# Altium schematic sheet Memory_Section.SchDoc
size A4; DocumentNumber: 22; SheetNumber: 22; SheetTotal: 28
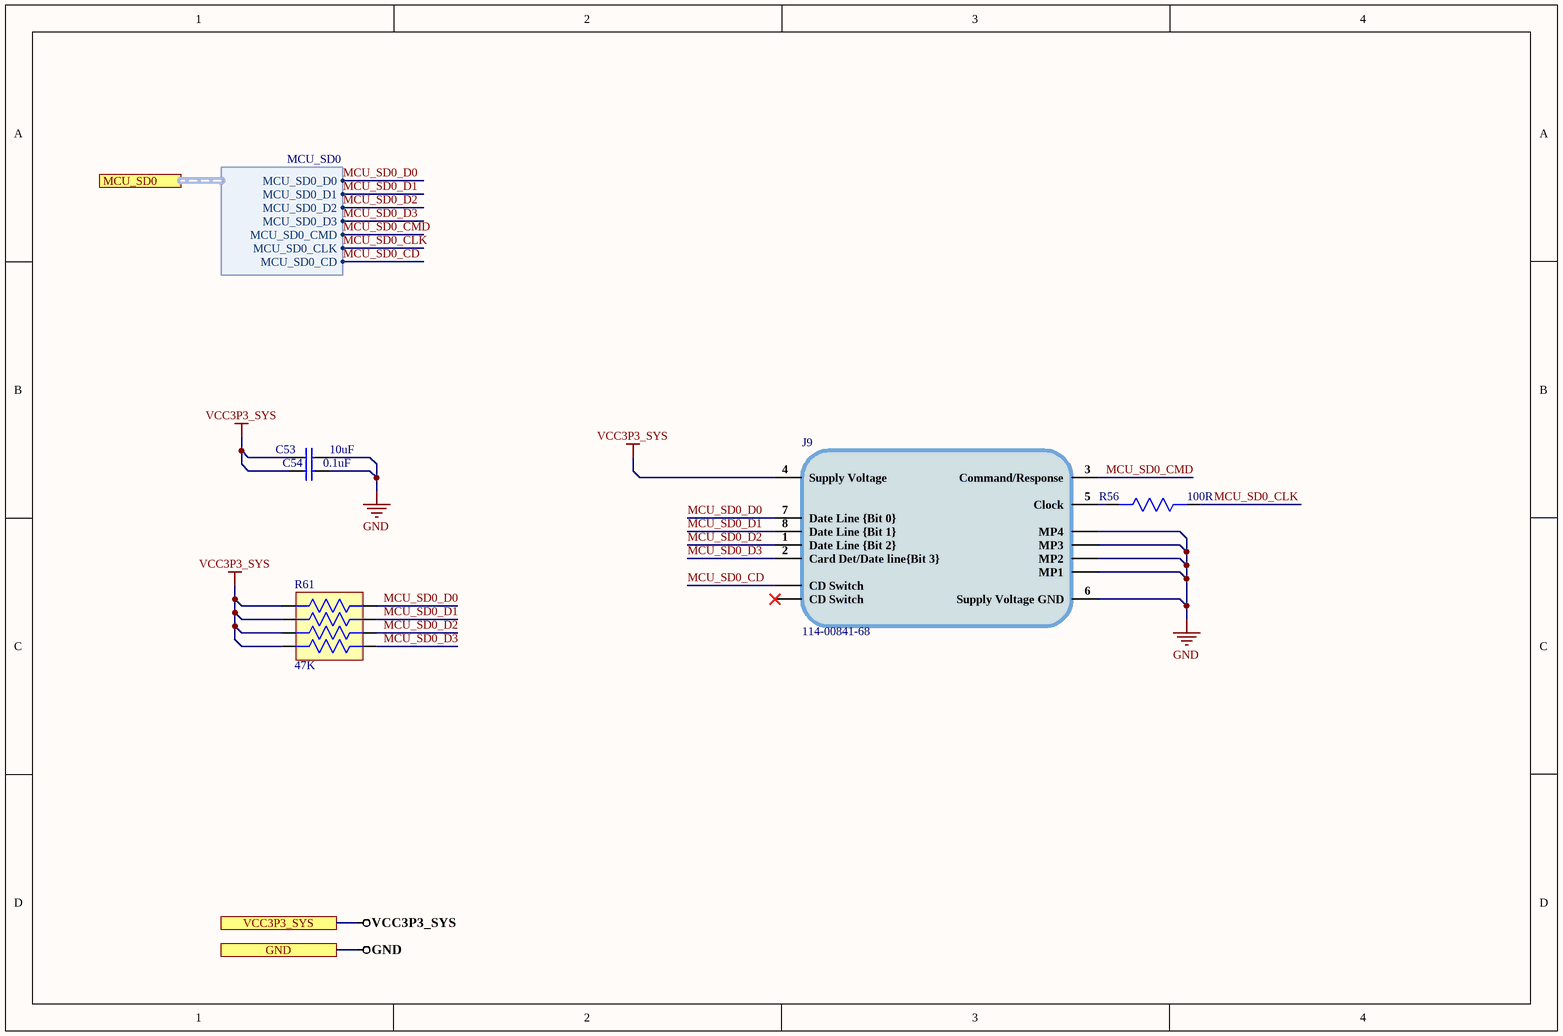
[diagram p0: Memory_Section.SchDoc]

## Parts
C53  10uF  [Cap0603]
C54  0.1uF  [Cap0603]
J9  114-00841-68  [114-00841-68]
R56  100R  [Res0603]
R61  47K  [CAY10-473J4LF]

## Ports
GND, MCU_SD0 (harness MCU_SD0), VCC3P3_SYS

## Harnesses
MCU_SD0: MCU_SD0_D0, MCU_SD0_D1, MCU_SD0_D2, MCU_SD0_D3, MCU_SD0_CMD, MCU_SD0_CLK, MCU_SD0_CD

## Nets
GND: C53.2 C54.2 J9.6(Supply_Voltage_GND) J9.MP1 J9.MP2 J9.MP3 J9.MP4 ; port GND
VCC3P3_SYS: C53.1 C54.1 J9.4(Supply_Voltage) R61.1 R61.2 R61.3 R61.4 ; port VCC3P3_SYS
MCU_SD0_CD: J9.*CD_Switch(CD_Switch) ; port MCU_SD0.MCU_SD0_CD
MCU_SD0_CLK: R56.1 ; port MCU_SD0.MCU_SD0_CLK
MCU_SD0_CMD: J9.3(Command/Response) ; port MCU_SD0.MCU_SD0_CMD
MCU_SD0_D0: J9.7(Date_Line_{Bit_0}) R61.8 ; port MCU_SD0.MCU_SD0_D0
MCU_SD0_D1: J9.8(Date_Line_{Bit_1}) R61.7 ; port MCU_SD0.MCU_SD0_D1
MCU_SD0_D2: J9.1(Date_Line_{Bit_2}) R61.6 ; port MCU_SD0.MCU_SD0_D2
MCU_SD0_D3: J9.2(Card_Det/Date_line{Bit_3}) R61.5 ; port MCU_SD0.MCU_SD0_D3
NetJ9_5: J9.5(Clock) R56.2

Not connected (* = marked no-connect by the designer): J9 #CD Switch(CD_Switch)*

## Library data of the parts
C53 = GRM188R6YA106MA73D: CAP CER 10UF 35V X5R 0603; Manufacturer: Murata; Tolerance: 20%; Supplier 1: Digi-Key; Manufacturer Part Number: GRM188R6YA106MA73D; Stock 1: 11640; Pricing 1: 1=0.5, 10=0.346, 100=0.2076, 500=0.1557, 1000=0.13148 (USD); Mount: Surface Mount; Case/Package: 0603; Case Code (Metric): 1608; Case Code (Imperial): 0603; Min Operating Temperature: -55°C; Max Operating Temperature: 85°C; Packaging: Tape and Reel; Capacitance: 10uF; Voltage Rating: 35V; Voltage Rating (DC): 35V; Dielectric: X5R; Length: 0.063inch; Width: 0.031inch; Thickness: 0.039inch; ComponentLink1URL: http://search.murata.co.jp/Ceramy/image/img/A01X/G101/ENG/GRM188R6YA106MA73-01.pdf?src-supplier=Digi-Key; ComponentLink1Description: http://search.murata.co.jp/Ceramy/image/img/A01X/G101/ENG/GRM188R6YA106MA73-01.pdf?src-supplier=Digi-Key; ComponentLink2URL: http://search.murata.co.jp/Ceramy/image/img/A01X/G101/ENG/GRM188R6YA106MA73-01.pdf?src-supplier=Mouser; ComponentLink2Description: http://search.murata.co.jp/Ceramy/image/img/A01X/G101/ENG/GRM188R6YA106MA73-01.pdf?src-supplier=Mouser; ComponentLink3URL: https://www.murata.com/~/media/webrenewal/support/library/catalog/products/capacitor/mlcc/c02e.ashx?la=en-us&src-supplier=Digi-Key; ComponentLink3Description: https://www.murata.com/~/media/webrenewal/support/library/catalog/products/capacitor/mlcc/c02e.ashx?la=en-us&src-supplier=Digi-Key; ComponentLink4URL: http://search.murata.co.jp/Ceramy/image/img/A01X/G101/ENG/GRM188R6YA106MA73-01.pdf?src-supplier=Future+Electronics; ComponentLink4Description: http://search.murata.co.jp/Ceramy/image/img/A01X/G101/ENG/GRM188R6YA106MA73-01.pdf?src-supplier=Future+Electronics; ComponentLink5URL: http://search.murata.co.jp/Ceramy/image/img/A01X/G101/ENG/GRM188R6YA106MA73-01.pdf?src-supplier=TTI; ComponentLink5Description: http://search.murata.co.jp/Ceramy/image/img/A01X/G101/ENG/GRM188R6YA106MA73-01.pdf?src-supplier=TTI; Supplier Part Number 1: 490-13248-6-ND
C54 = CC0603ZRY5V9BB104: CAP CER 0.1UF 50V Y5V 0603; Manufacturer: Yageo; Capacitance: 100nF; Tolerance: 80%; Supplier 1: Digi-Key; Manufacturer Part Number: CC0603ZRY5V9BB104; Stock 1: 15000880; Pricing 1: 1=0.1, 10=0.075, 100=0.0334, 500=0.02386, 1000=0.01874 (USD); Mount: Surface Mount; Case/Package: 0603; Number of Pins: 2; Case Code (Metric): 1608; Case Code (Imperial): 0603; Min Operating Temperature: -30°C; Max Operating Temperature: 85°C; Dielectric: Y5V; Voltage Rating: 50V; Package Quantity: 1; Packaging: Tape and Reel; Voltage Rating (DC): 50V; Termination: SMD/SMT; Composition: Ceramic; Voltage: 50V; Length: 1.6mm; Height: 0.8mm; Width: 0.031inch; Thickness: 0.035inch; Depth: 0.8mm; Radiation Hardening: No; REACH SVHC: No SVHC; Lead Free: Lead Free; Halogen Free: Halogen Free; ComponentLink1URL: http://www.yageo.com/documents/recent/UPY-GPHC_Y5V_6.3V-to-50V_8.pdf?src-supplier=Digi-Key; ComponentLink1Description: http://www.yageo.com/documents/recent/UPY-GPHC_Y5V_6.3V-to-50V_8.pdf?src-supplier=Digi-Key; ComponentLink2URL: http://www.yageo.com/documents/recent/UPY-GPHC_Y5V_6.3V-to-50V_5.pdf?src-supplier=Avnet+Europe; ComponentLink2Description: http://www.yageo.com/documents/recent/UPY-GPHC_Y5V_6.3V-to-50V_5.pdf?src-supplier=Avnet+Europe; ComponentLink3URL: https://www.verical.com/server-webapp/html/getDatasheet?partID=403611&src-supplier=Verical; ComponentLink3Description: https://www.verical.com/server-webapp/html/getDatasheet?partID=403611&src-supplier=Verical; ComponentLink4URL: http://www.mouser.com/ds/2/447/Yageo_UPY-GP_NP0_16V-to-50V_9-358835.pdf?src-supplier=Mouser; ComponentLink4Description: http://www.mouser.com/ds/2/447/Yageo_UPY-GP_NP0_16V-to-50V_9-358835.pdf?src-supplier=Mouser; ComponentLink5URL: http://www.farnell.com/datasheets/1132289.pdf?src-supplier=Element14; ComponentLink5Description: http://www.farnell.com/datasheets/1132289.pdf?src-supplier=Element14; Supplier Part Number 1: 311-1343-1-ND
J9 = 114-00841-68: CONN MICRO SD CARD PUSH-PULL R/A; Manufacturer: AMPHENOL ICC (COMMERCIAL PRODUCTS); Connector Type: Connector; Supplier 1: Digi-Key; Manufacturer Part Number: 114-00841-68; Stock 1: 29968; Pricing 1: 1=1.32, 10=1.194, 25=1.1208, 50=1.0722, 100=1.0235, 250=0.926, 500=0.8529 (USD); Mount: Surface Mount; Contact Plating: Gold; Packaging: Tape and Reel; Supplier Part Number 1: 114-00841-68-6-ND
R56 = RC0603FR-07100RL: RES SMD 100 OHM 1% 1/10W 0603; Manufacturer: Yageo; Temperature Coefficient: 100ppm/°C; Voltage Rating (DC): 50V; Power Rating: 100mW; Supplier 1: Arrow Electronics; Manufacturer Part Number: RC0603FR-07100RL; RoHS: Yes; Category: Chip SMD Resistors; Stock 1: 3800000; Pricing 1: 5000=0.00300, 5000=0.00200, 5000=0.00450, 50000=0.00410, 500000=0.00230, 2500000=0.00140 (USD); Case/Package: 0603; Number of Pins: 2; Case Code (Imperial): 0603; Case Code (Metric): 1608; Size Code: 0603; Min Operating Temperature: -55°C; Max Operating Temperature: 155°C; Resistance: 100R; Tolerance: 1%; Resistor Type: Thick Film; Packaging: Tape and Reel; Voltage Rating: 50V; Termination: SMD/SMT; Features: Moisture Resistant; Series: RC; Max Power Dissipation: 100mW; Number of Terminations: 2; Construction: Rectangular; Resistance Tolerance: 1%; Technology: THICK FILM; Length: 1.6mm; Width: 0.8mm; Height: 0.45mm; Depth: 0.8mm; REACH SVHC: Unknown; Lead Free: Lead Free; RoHS Compliant: Yes; Military Standard: Not; Supplier Part Number 1: RC0603FR-07100RL
R61 = CAY10-473J4LF: RES ARRAY 4 RES 47K OHM 0804; Manufacturer: Bourns; Number of Terminals/Pins: 8; Resistance: 47kR; Number of Resistors: 4; Temperature Coefficient: 250ppm/°C; Power Rating: 125mW; Tolerance: 5%; Voltage Rating: 25V; Circuit Type: Isolated; Power Per Element: 62.5mW; Supplier 1: Digi-Key; Manufacturer Part Number: CAY10-473J4LF; RoHS: Yes; Category: Resistor Arrays; Stock 1: 11037; Pricing 1: 1=0.12000, 10=0.10400, 25=0.07200, 50=0.05600, 100=0.04000, 250=0.03120, 500=0.02480, 1000=0.01760, 5000=0.01360 (USD); Mount: Surface Mount; Case/Package: 0804; Number of Pins: 8; Case Code (Metric): 2010; Case Code (Imperial): 0804; Contact Plating: Tin; Min Operating Temperature: -55°C; Max Operating Temperature: 125°C; Packaging: Tape and Reel; Package Quantity: 1; Number of Elements: 4; Termination: Convex; Voltage Rating (DC): 25V; Series: CAY10; Resistance Tolerance: 5%; Technology: THICK FILM; Length: 2mm; Width: 0.039inch; Height: 0.018inch; Terminal Pitch: 0.5mm; Depth: 1mm; REACH SVHC: No SVHC; Military Standard: Not; RoHS Compliant: Yes; ComponentLink1URL: https://datasheet.ciiva.com/11807/0900766b8064e463-11807137.pdf?src-supplier=RSComponents; ComponentLink1Description: https://datasheet.ciiva.com/11807/0900766b8064e463-11807137.pdf?src-supplier=RSComponents; ComponentLink2URL: https://datasheet.ciiva.com/6494/cay10-6494182.pdf?src-supplier=Digi-Key; ComponentLink2Description: https://datasheet.ciiva.com/6494/cay10-6494182.pdf?src-supplier=Digi-Key; ComponentLink3URL: https://datasheet.ciiva.com/16965/cay10-16965867.pdf?src-supplier=Avnet+Europe; ComponentLink3Description: https://datasheet.ciiva.com/16965/cay10-16965867.pdf?src-supplier=Avnet+Europe; ComponentLink4URL: https://datasheet.ciiva.com/22712/467939-22712716.pdf?src-supplier=Element14; ComponentLink4Description: https://datasheet.ciiva.com/22712/467939-22712716.pdf?src-supplier=Element14; ComponentLink5URL: https://datasheet.ciiva.com/6494/cay10-6494183.pdf?src-supplier=Digi-Key; ComponentLink5Description: https://datasheet.ciiva.com/6494/cay10-6494183.pdf?src-supplier=Digi-Key; ComponentLink6URL: https://datasheet.ciiva.com/6494/cay10-6494184.pdf?src-supplier=Digi-Key; ComponentLink6Description: https://datasheet.ciiva.com/6494/cay10-6494184.pdf?src-supplier=Digi-Key; ComponentLink7URL: https://datasheet.ciiva.com/8370/cay10-8370974.pdf?src-supplier=Avnet; ComponentLink7Description: https://datasheet.ciiva.com/8370/cay10-8370974.pdf?src-supplier=Avnet; ComponentLink8URL: https://datasheet.ciiva.com/48692/001055368-da-01-en-wid-arr-cay10-473j4lf-47k-ohm-4-w-0804-48692103.pdf?src-supplier=Conrad; ComponentLink8Description: https://datasheet.ciiva.com/48692/001055368-da-01-en-wid-arr-cay10-473j4lf-47k-ohm-4-w-0804-48692103.pdf?src-supplier=Conrad; Supplier Part Number 1: CAY10-473J4LFCT-ND